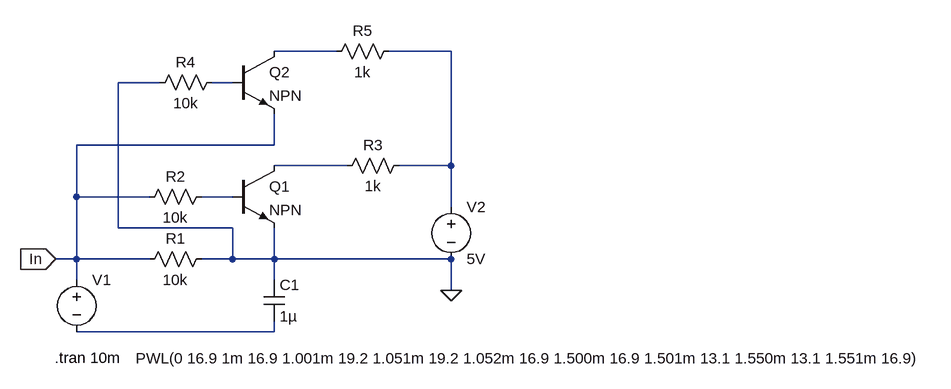
[diagram p0: schematic Pegelkonverter.asc]
Pegelkonverter.asc, the LTspice schematic file:
Version 4
SHEET 1 1288 680
WIRE 384 -784 288 -784
WIRE 560 -784 464 -784
WIRE 112 -736 48 -736
WIRE 224 -736 192 -736
WIRE 288 -640 288 -688
WIRE 288 -640 -16 -640
WIRE 400 -608 288 -608
WIRE 560 -608 560 -784
WIRE 560 -608 480 -608
WIRE -16 -560 -16 -640
WIRE 96 -560 -16 -560
WIRE 224 -560 176 -560
WIRE 560 -544 560 -608
WIRE 48 -512 48 -736
WIRE 224 -512 48 -512
WIRE -16 -464 -16 -560
WIRE -16 -464 -48 -464
WIRE 96 -464 -16 -464
WIRE 224 -464 224 -512
WIRE 224 -464 176 -464
WIRE 288 -464 288 -512
WIRE 288 -464 224 -464
WIRE 560 -464 288 -464
WIRE -16 -432 -16 -464
WIRE 288 -432 288 -464
WIRE 560 -416 560 -464
WIRE 288 -352 288 -368
WIRE 288 -352 -16 -352
FLAG 560 -416 0
FLAG -48 -464 In
IOPIN -48 -464 In
SYMBOL voltage -16 -448 R0
WINDOW 3 91 137 Left 2
WINDOW 123 0 0 Left 0
WINDOW 39 0 0 Left 0
SYMATTR InstName V1
SYMATTR Value PWL(0 16.9 1m 16.9 1.001m 19.2 1.051m 19.2 1.052m 16.9 1.500m 16.9 1.501m 13.1 1.550m 13.1 1.551m 16.9)
SYMBOL res 192 -480 R90
WINDOW 0 0 56 VBottom 2
WINDOW 3 32 56 VTop 2
SYMATTR InstName R1
SYMATTR Value 10k
SYMBOL cap 272 -432 R0
SYMATTR InstName C1
SYMATTR Value 1µ
SYMBOL npn 224 -608 R0
SYMATTR InstName Q1
SYMBOL res 192 -576 R90
WINDOW 0 0 56 VBottom 2
WINDOW 3 32 56 VTop 2
SYMATTR InstName R2
SYMATTR Value 10k
SYMBOL voltage 560 -560 R0
WINDOW 123 0 0 Left 0
WINDOW 39 0 0 Left 0
SYMATTR InstName V2
SYMATTR Value 5V
SYMBOL res 496 -624 R90
WINDOW 0 0 56 VBottom 2
WINDOW 3 32 56 VTop 2
SYMATTR InstName R3
SYMATTR Value 1k
SYMBOL npn 224 -784 R0
SYMATTR InstName Q2
SYMBOL res 208 -752 R90
WINDOW 0 0 56 VBottom 2
WINDOW 3 32 56 VTop 2
SYMATTR InstName R4
SYMATTR Value 10k
SYMBOL res 480 -800 R90
WINDOW 0 0 56 VBottom 2
WINDOW 3 32 56 VTop 2
SYMATTR InstName R5
SYMATTR Value 1k
TEXT -50 -312 Left 2 !.tran 10m

The netlist it stands for:
* Pegelkonverter.asc
V1 In N006 PWL(0 16.9 1m 16.9 1.001m 19.2 1.051m 19.2 1.052m 16.9 1.500m 16.9 1.501m 13.1 1.550m 13.1 1.551m 16.9)
R1 0 In 10k
C1 0 N006 1µ
Q1 N004 N005 0 0 NPN
R2 N005 In 10k
V2 N002 0 5V
R3 N002 N004 1k
Q2 N001 N003 In 0 NPN
R4 N003 0 10k
R5 N002 N001 1k
.model NPN NPN
.model PNP PNP
.lib standard.bjt
.tran 10m
.backanno
.end